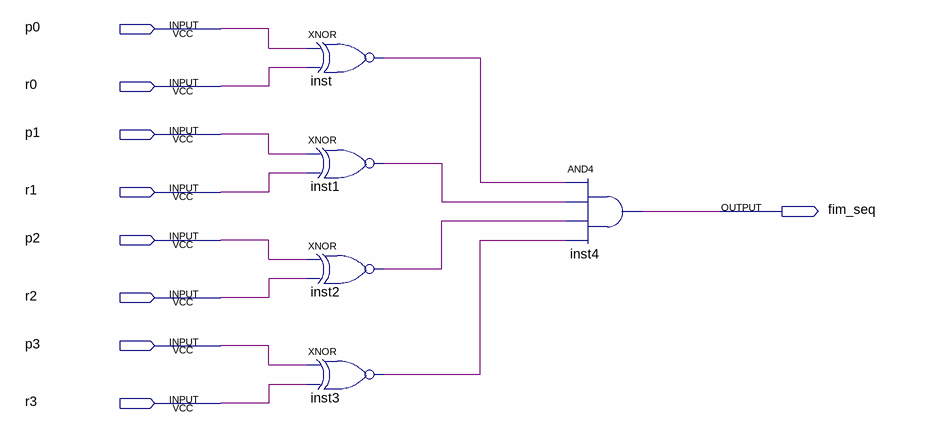
[diagram p0: schematic sheet]
// Quartus schematic comparador4.bdf as structural Verilog: 5 symbols, 9 pins
module comparador4 (
  input  p0,
  input  r0,
  input  p1,
  input  r1,
  input  p2,
  input  r2,
  input  p3,
  input  r3,
  output fim_seq
);

  wire inst1_out, inst2_out, inst3_out, inst_out;

  xnor inst (inst_out, p0, r0);
  xnor inst1 (inst1_out, p1, r1);
  xnor inst2 (inst2_out, p2, r2);
  xnor inst3 (inst3_out, p3, r3);
  and inst4 (fim_seq, inst_out, inst1_out, inst2_out, inst3_out);
endmodule
